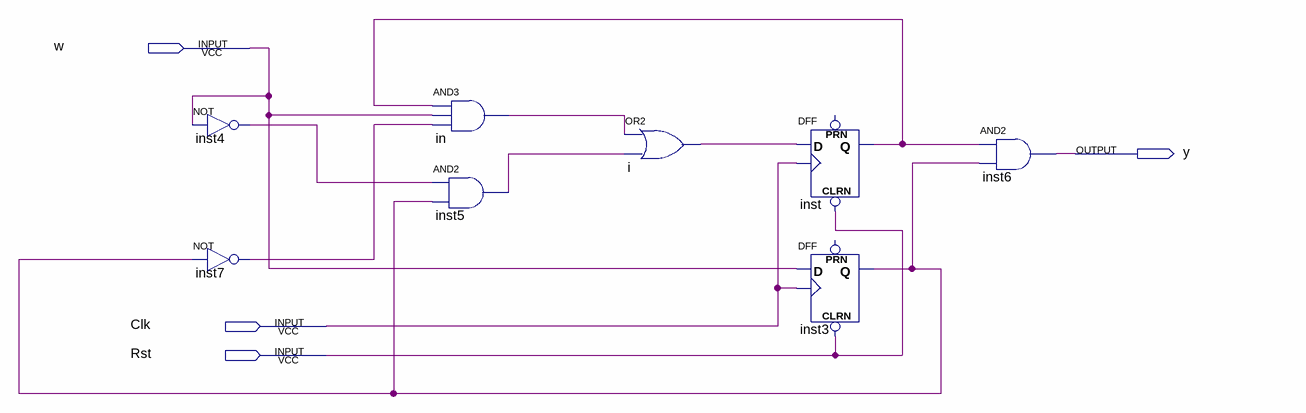
[diagram p0: schematic sheet]
// Quartus schematic MooreFSMDiagram.bdf as structural Verilog: 8 symbols, 4 pins
module MooreFSMDiagram (
  input  w,
  input  Clk,
  input  Rst,
  output y
);

  wire i_out, in_out, inst3_q, inst4_out, inst5_out, inst7_out, inst_q;

  not inst4 (inst4_out, w);
  not inst7 (inst7_out, inst3_q);
  and in (in_out, inst_q, w, inst7_out);
  and inst5 (inst5_out, inst4_out, inst3_q);
  or i (i_out, in_out, inst5_out);
  DFF inst (.CLRN(Rst), .CLK(Clk), .D(i_out), .Q(inst_q));  // open: PRN
  DFF inst3 (.CLRN(Rst), .CLK(Clk), .D(w), .Q(inst3_q));  // open: PRN
  and inst6 (y, inst_q, inst3_q);
endmodule
